# Altium schematic sheet Power_Sheet.SchDoc
size A4; DocumentNumber: 2; SheetNumber: 2; SheetTotal: 4
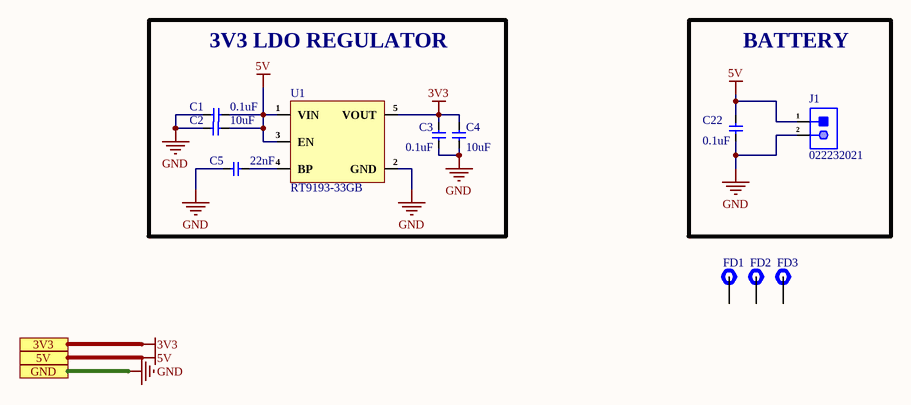
[diagram p0: Power_Sheet.SchDoc]

## Parts
C1  0.1uF  [Cap-0805]
C2  10uF  [Cap-0805]
C3  0.1uF  [Cap-0805]
C4  10uF  [Cap-0805]
C5  22nF  [Cap-0805]
C22  0.1uF  [Cap-0805]
FD1  Fiducial Mark  [Fiducial mark]  (value not drawn)
FD2  Fiducial Mark  [Fiducial mark]  (value not drawn)
FD3  Fiducial Mark  [Fiducial mark]  (value not drawn)
J1  022232021  [022232021]
U1  RT9193-33GB  [SOT-23-5]

## Blocks framed on the sheet
3V3 LDO REGULATOR: C1-C5 U1
BATTERY: C22 J1

## Ports
3V3 (see Top_Sheet[1B], Controller_Sheet[1D], Peripheral_Sheet[2D]), 5V (see Top_Sheet[1B], Controller_Sheet[1D], Peripheral_Sheet[2D]), GND (see Top_Sheet[2B], Controller_Sheet[1D], Peripheral_Sheet[2D])

## Nets
3V3: C3.2 C4.2 U1.5(VOUT) ; port 3V3
5V: C1.1 C2.2 C22.2 J1.1 U1.1(VIN) U1.3(EN) ; port 5V
GND: C1.2 C2.1 C3.1 C4.1 C5.1 C22.1 J1.2 U1.2(GND) ; port GND
NetC5_2: C5.2 U1.4(BP)

Not connected (* = marked no-connect by the designer): FD1 1; FD2 1; FD3 1

## Notes on the sheet
- File:
- Title:
- Date:
- Page
- Num:
- Total:
- Drawn By: Huzaifa Ali

## Library data of the parts
C1 C3 C22 = CL21B104KBCNNNC: Multilayer Ceramic Capacitor, 0.1 uF, 50 V, ± 10%, X7R, 0805 [2012 Metric]; Manufacturer: Samsung; Value: 100nF; Voltage Rating: 50V; Supplier: Digikey; Supplier Part Number: 1276-1003-1-ND; Manufacturer Part Number: CL21B104KBCNNNC; RoHS: Yes; Category: Ceramic Capacitors; Stock: 2193973; Pricing: 1=0.1, 10=0.042, 50=0.024, 100=0.0186, 500=0.01404, 1000=0.01103 (USD); Mounting Technology: Surface Mount; Case/Package: 0805; Case Code (Metric): 2012; Case Code (Imperial): 0805; Material: Ceramic; Min Operating Temperature: -55°C; Max Operating Temperature: 125°C; Tolerance: 10%; Dielectric: X7R; Packaging: Tape and Reel; Voltage: 50V; Series: CL; Construction: Flat; Voltage Rating (DC): 50V; Length: 2mm; Width: 0.049inch; Height: 0.85mm; Depth: 1.25mm; Thickness: 0.037inch; Radiation Hardening: No; RoHS Compliant: Yes; Lead Free: 5697LeadFree; ComponentLink1URL: https://datasheet.ciiva.com/25710/cl21b104kbcnnnc-25710182.pdf?src-supplier=Digikey; ComponentLink1Description: https://datasheet.ciiva.com/25710/cl21b104kbcnnnc-25710182.pdf?src-supplier=Digikey; ComponentLink2URL: https://datasheet.ciiva.com/29199/454152-da-01-en-vs-kondensator-0805-29199814.pdf?src-supplier=Conrad; ComponentLink2Description: https://datasheet.ciiva.com/29199/454152-da-01-en-vs-kondensator-0805-29199814.pdf?src-supplier=Conrad; Item Type: Capacitor
C2 C4 = CL21A106KOQNNNE: Multilayer Ceramic Capacitor, 10 uF, 16 V, ± 10%, X5R, 0805 [2012 Metric]; Manufacturer: Samsung; Voltage Rating: 16V; Dielectric: X7R; Supplier: Digikey; Supplier Part Number: 1276-1096-1-ND; Manufacturer Part Number: CL21A106KOQNNNE; RoHS: Yes; Category: Ceramic Capacitors; Stock: 4169901; Pricing: 1=0.1, 10=0.07, 50=0.0404, 100=0.0313, 500=0.02354, 1000=0.0185 (USD); Mounting Technology: Surface Mount; Case/Package: 0805; Material: Ceramic; Case Code (Metric): 2012; Case Code (Imperial): 0805; Min Operating Temperature: -55°C; Max Operating Temperature: 85°C; Package Quantity: 1; Packaging: Tape and Reel; Value: 10uF; Tolerance: 10%; Voltage Rating (DC): 16V; Voltage: 16V; Series: CL; Construction: Flat; Length: 2mm; Width: 0.049inch; Height: 1.25mm; Thickness: 0.055inch; Depth: 1.25mm; Radiation Hardening: No; Lead Free: Lead Free; RoHS Compliant: Yes; ComponentLink1URL: https://datasheet.ciiva.com/25798/cl21a106koqnnne-25798133.pdf?src-supplier=Digikey; ComponentLink1Description: https://datasheet.ciiva.com/25798/cl21a106koqnnne-25798133.pdf?src-supplier=Digikey; Item Type: Capacitor; Package: 0805; LCSC Part Number: C1713
C5 = CL21B223KBANNNC: Multilayer Ceramic Capacitor, 0.022 uF, 50 V, ± 10%, X7R, 0805 [2012 Metric]; Manufacturer: Samsung; Voltage: 50V; Supplier: Digikey; Supplier Part Number: 1276-1081-1-ND; Manufacturer Part Number: CL21B223KBANNNC; RoHS: Yes; Category: Ceramic Capacitors; Stock: 135727; Pricing: 1=0.1, 10=0.032, 50=0.0184, 100=0.0143, 500=0.01074, 1000=0.00844 (USD); Mounting Technology: Surface Mount; Case/Package: 0805; Case Code (Metric): 2012; Case Code (Imperial): 0805; Material: Ceramic; Min Operating Temperature: -55°C; Max Operating Temperature: 125°C; Tolerance: 10%; Value: 22nF; Dielectric: X7R; Voltage Rating (DC): 50V; Packaging: Tape and Reel; Package Quantity: 1; Voltage Rating: 50V; Series: CL; Construction: Flat; Length: 2mm; Width: 0.049inch; Height: 0.65mm; Depth: 1.25mm; Thickness: 0.03inch; Radiation Hardening: No; Lead Free: Lead Free; RoHS Compliant: Yes; ComponentLink1URL: https://datasheet.ciiva.com/25800/cl21b223kbannnc-25800850.pdf?src-supplier=Digikey; ComponentLink1Description: https://datasheet.ciiva.com/25800/cl21b223kbannnc-25800850.pdf?src-supplier=Digikey; ComponentLink2URL: https://datasheet.ciiva.com/26838/getdatasheetpartid-498011-26838697.pdf?src-supplier=Verical; ComponentLink2Description: https://datasheet.ciiva.com/26838/getdatasheetpartid-498011-26838697.pdf?src-supplier=Verical; ComponentLink3URL: https://datasheet.ciiva.com/29199/454724-da-01-en-vs-kondensator-0805-29199517.pdf?src-supplier=Conrad; ComponentLink3Description: https://datasheet.ciiva.com/29199/454724-da-01-en-vs-kondensator-0805-29199517.pdf?src-supplier=Conrad; Item Type: Capacitor; Package: 0805; LCSC Part Number: C1729
J1 = 022232021: CONN HEADER VERT 2POS 2.54MM; Manufacturer: Molex; Supplier: Mouser; Supplier Part Number: 538-22-23-2021; Manufacturer Part Number: 022232021; RoHS: No; Category: Uncategorized; Stock: 51848; Pricing: 1=0.21, 10=0.127, 50=0.127, 100=0.096, 1000=0.086, 10000=0.073 (USD)
U1 = RT9193-33GB: IC REG LDO 3.3V 0.3A SOT23-5; Manufacturer: Richtek; Supplier: Digi-Key; Supplier Part Number: 1028-1014-1-ND; Manufacturer Part Number: RT9193-33GB; RoHS: Yes; Category: Voltage Regulators - Linear; Stock: 7748; Pricing: 1=0.53, 10=0.454, 25=0.424, 100=0.3394, 250=0.31512, 500=0.26664, 1000=0.20604 (USD); ComponentLink1URL: https://datasheet.ciiva.com/2046/3d3futf-83fb3frfm5mtkzlte2lnbkzg3d3d3f3d-2046896.pdf?src-supplier=Digi-Key; ComponentLink1Description: https://datasheet.ciiva.com/2046/3d3futf-83fb3frfm5mtkzlte2lnbkzg3d3d3f3d-2046896.pdf?src-supplier=Digi-Key; ComponentLink2URL: https://datasheet.ciiva.com/28652/1782157-28652989.pdf?src-supplier=Element14; ComponentLink2Description: https://datasheet.ciiva.com/28652/1782157-28652989.pdf?src-supplier=Element14